# Altium project Servo-Driver-v2.0.PrjPcb (part 20 of 20)
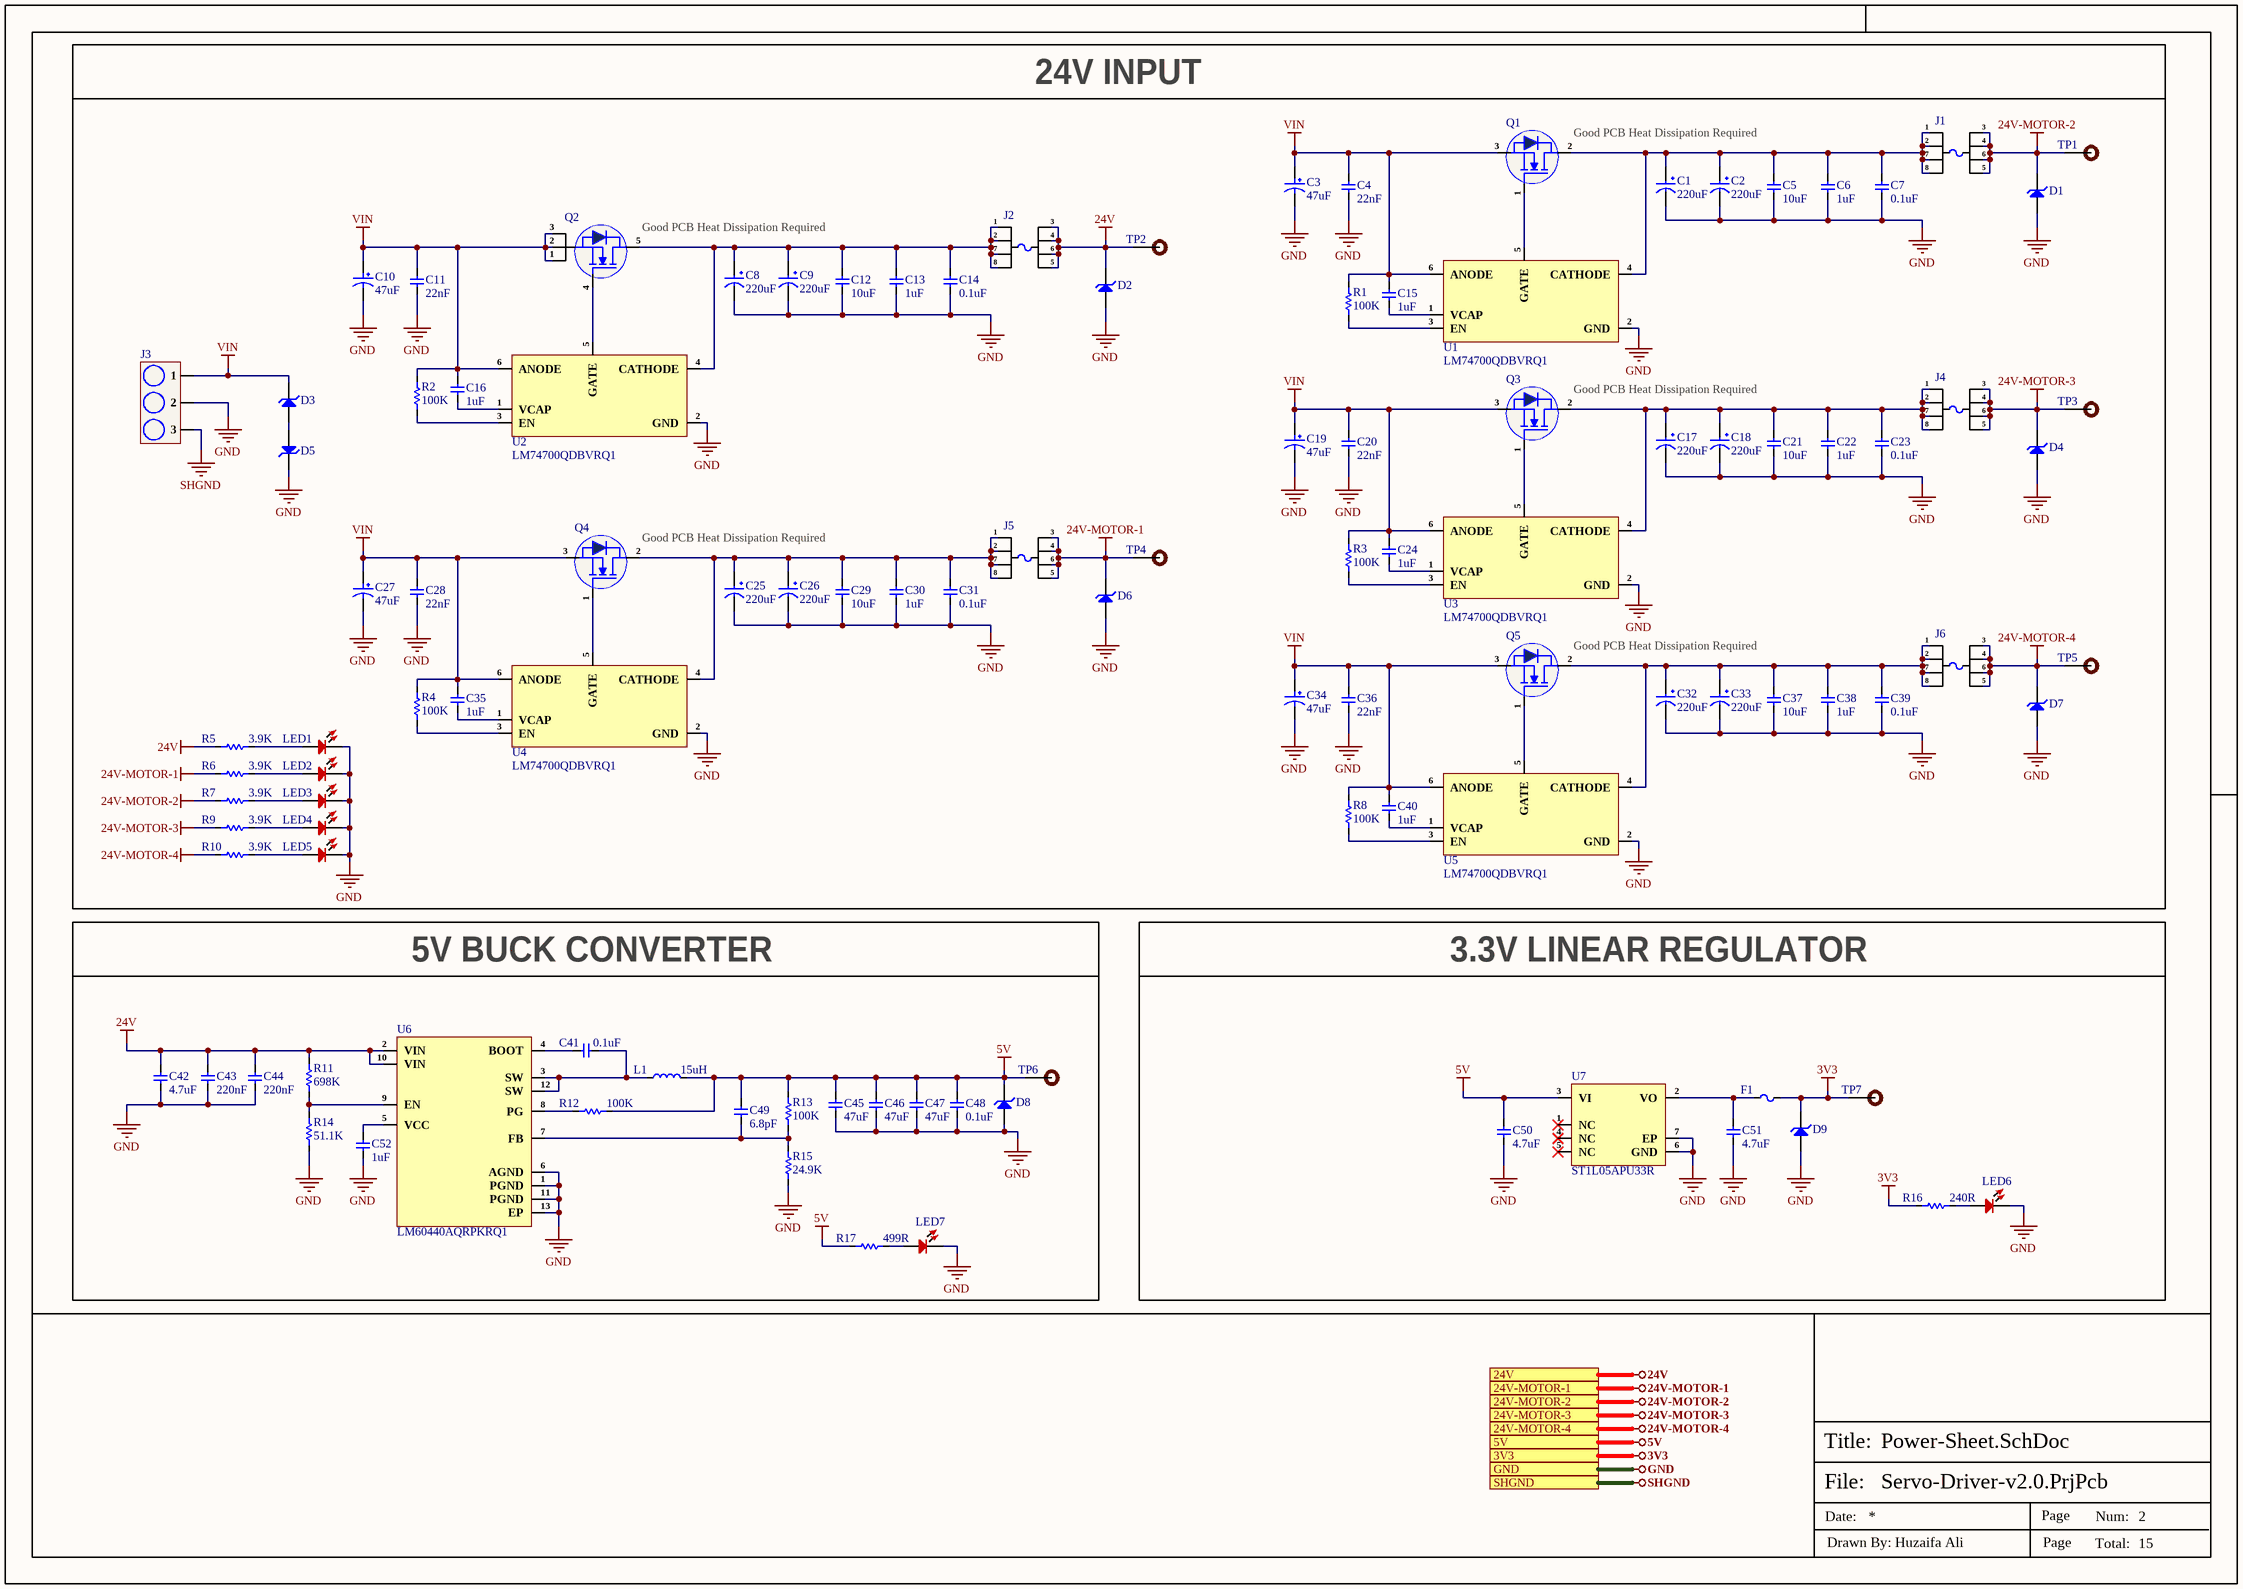
[diagram p114: Power-Sheet.SchDoc]

## Nets that join several sheets
3V3: Controller-Driver-Sheet-4 (Q33.1 R448.2 R449.2 R485.2), MOSFET-Motor-Sheet-4 (C195.2 C197.2 Q41.4 U21.8), Controller-Comms-Sheet-4 (7 pins), Controller-Driver-Sheet-3 (Q24.1 R309.2 R310.2 R346.2), MOSFET-Motor-Sheet-3 (C157.2 C159.2 Q32.4 U17.8), Controller-Comms-Sheet-3 (7 pins), Controller-Driver-Sheet-2 (Q15.1 R170.2 R171.2 R207.2), MOSFET-Motor-Sheet-2 (C119.2 C121.2 Q23.4 U13.8), Controller-Comms-Sheet-2 (7 pins), Controller-Driver-Sheet-1 (Q6.1 R31.2 R32.2 R68.2), MOSFET-Motor-Sheet-1 (C81.2 C83.2 Q14.4 U9.8), Controller-Comms-Sheet-1 (7 pins), Power-Sheet (D9.2 F1.2 R16.1 TP7.1)
5V: Controller-Driver-Sheet-4 (C185.2 LED11.2 R486.2), MOSFET-Motor-Sheet-4 (R559.1 R562.1), Controller-Driver-Sheet-3 (C147.2 LED10.2 R347.2), MOSFET-Motor-Sheet-3 (R420.1 R423.1), Controller-Driver-Sheet-2 (C109.2 LED9.2 R208.2), MOSFET-Motor-Sheet-2 (R281.1 R284.1), Controller-Driver-Sheet-1 (C71.2 LED8.2 R69.2), MOSFET-Motor-Sheet-1 (R142.1 R145.1), Power-Sheet (13 pins)
24V-MOTOR-1: Controller-Driver-Sheet-1 (R25.2 R98.2), MOSFET-Motor-Sheet-1 (11 pins), Power-Sheet (7 pins)
24V-MOTOR-2: Controller-Driver-Sheet-2 (R164.2 R237.2), MOSFET-Motor-Sheet-2 (11 pins), Power-Sheet (7 pins)
24V-MOTOR-3: Controller-Driver-Sheet-3 (R303.2 R376.2), MOSFET-Motor-Sheet-3 (11 pins), Power-Sheet (7 pins)
24V-MOTOR-4: Controller-Driver-Sheet-4 (R442.2 R515.2), MOSFET-Motor-Sheet-4 (11 pins), Power-Sheet (7 pins)
GND: Comms-In (D10.3 D11.3 R18.1 R19.1), Controller-Driver-Sheet-4 (48 pins), MOSFET-Motor-Sheet-4 (29 pins), Controller-Comms-Sheet-4 (8 pins), Controller-Driver-Sheet-3 (48 pins), MOSFET-Motor-Sheet-3 (29 pins), Controller-Comms-Sheet-3 (8 pins), Controller-Driver-Sheet-2 (48 pins), MOSFET-Motor-Sheet-2 (29 pins), Controller-Comms-Sheet-2 (8 pins), Controller-Driver-Sheet-1 (48 pins), MOSFET-Motor-Sheet-1 (29 pins), Controller-Comms-Sheet-1 (8 pins), Power-Sheet (74 pins)
MCU1_VCC: Controller-Driver-Sheet-1 (7 pins), MOSFET-Motor-Sheet-1 (C82.2 Q14.1)
MCU1_VDD: Controller-Driver-Sheet-1 (10 pins), MOSFET-Motor-Sheet-1 (6 pins)
MCU2_VCC: Controller-Driver-Sheet-2 (7 pins), MOSFET-Motor-Sheet-2 (C120.2 Q23.1)
MCU2_VDD: Controller-Driver-Sheet-2 (10 pins), MOSFET-Motor-Sheet-2 (6 pins)
MCU3_VCC: Controller-Driver-Sheet-3 (7 pins), MOSFET-Motor-Sheet-3 (C158.2 Q32.1)
MCU3_VDD: Controller-Driver-Sheet-3 (10 pins), MOSFET-Motor-Sheet-3 (6 pins)
MCU4_VCC: Controller-Driver-Sheet-4 (7 pins), MOSFET-Motor-Sheet-4 (C196.2 Q41.1)
MCU4_VDD: Controller-Driver-Sheet-4 (10 pins), MOSFET-Motor-Sheet-4 (6 pins)
SHGND: MOSFET-Motor-Sheet-4 (J41.4 J44.1), MOSFET-Motor-Sheet-3 (J31.4 J34.1), MOSFET-Motor-Sheet-2 (J21.4 J24.1), MOSFET-Motor-Sheet-1 (J11.4 J14.1), Power-Sheet (J3.3)
CAN_N: Comms-In (D10.2 J7.5), Controller-Comms-Sheet-4 (J46.2 R568.2), Controller-Comms-Sheet-3 (J36.2 R429.2), Controller-Comms-Sheet-2 (J26.2 R290.2), Controller-Comms-Sheet-1 (J16.2 R151.2)
CAN_P: Comms-In (D10.1 J7.4), Controller-Comms-Sheet-4 (R566.2 R569.2), Controller-Comms-Sheet-3 (R427.2 R430.2), Controller-Comms-Sheet-2 (R288.2 R291.2), Controller-Comms-Sheet-1 (R149.2 R152.2)
MCU1_485_DIN: Controller-Driver-Sheet-1 (R61.2), Controller-Comms-Sheet-1 (U11.4)
MCU1_485_ROUT: Controller-Driver-Sheet-1 (R62.2 R72.2), Controller-Comms-Sheet-1 (U11.1)
MCU1_BOOT1: Controller-Driver-Sheet-1 (R66.1 U8.41), MOSFET-Motor-Sheet-1 (C75.2)
MCU1_BOOT2: Controller-Driver-Sheet-1 (R70.1 U8.38), MOSFET-Motor-Sheet-1 (C76.2)
MCU1_BOOT3: Controller-Driver-Sheet-1 (R73.1 U8.35), MOSFET-Motor-Sheet-1 (C77.2)
MCU1_CAN_RX: Controller-Driver-Sheet-1 (R39.2), Controller-Comms-Sheet-1 (R150.1)
MCU1_CAN_SHDN: Controller-Driver-Sheet-1 (R64.2), Controller-Comms-Sheet-1 (R153.1)
MCU1_CAN_STB: Controller-Driver-Sheet-1 (R65.2), Controller-Comms-Sheet-1 (R147.1)
MCU1_CAN_TX: Controller-Driver-Sheet-1 (R40.2), Controller-Comms-Sheet-1 (R148.1)
MCU1_DR_RCV_EN: Controller-Driver-Sheet-1 (R59.2), Controller-Comms-Sheet-1 (R158.1 U11.2 U11.3)
MCU1_GHS1: Controller-Driver-Sheet-1 (U8.43), MOSFET-Motor-Sheet-1 (D25.1 R113.1)
MCU1_GHS2: Controller-Driver-Sheet-1 (U8.40), MOSFET-Motor-Sheet-1 (D26.1 R114.1)
MCU1_GHS3: Controller-Driver-Sheet-1 (U8.37), MOSFET-Motor-Sheet-1 (D27.1 R115.1)
MCU1_GLS1: Controller-Driver-Sheet-1 (U8.29), MOSFET-Motor-Sheet-1 (D28.1 R122.1)
MCU1_GLS2: Controller-Driver-Sheet-1 (U8.30), MOSFET-Motor-Sheet-1 (D29.1 R123.1)
MCU1_GLS3: Controller-Driver-Sheet-1 (U8.31), MOSFET-Motor-Sheet-1 (D30.1 R124.1)
MCU1_HALL1: Controller-Driver-Sheet-1 (R56.2), MOSFET-Motor-Sheet-1 (C86.2 D35.1 R141.1)
MCU1_HALL2: Controller-Driver-Sheet-1 (R58.2), MOSFET-Motor-Sheet-1 (C85.2 D34.1 R143.1)
MCU1_HALL3: Controller-Driver-Sheet-1 (R60.2 R72.1), MOSFET-Motor-Sheet-1 (C84.2 D33.1 R144.1)
MCU1_OUT1: Controller-Driver-Sheet-1 (U8.42), MOSFET-Motor-Sheet-1 (C75.1 R116.1)
MCU1_OUT2: Controller-Driver-Sheet-1 (U8.39), MOSFET-Motor-Sheet-1 (C76.1 R117.1)
MCU1_OUT3: Controller-Driver-Sheet-1 (U8.36), MOSFET-Motor-Sheet-1 (C77.1 R118.1)
MCU1_PA8: Controller-Driver-Sheet-1 (R36.2), MOSFET-Motor-Sheet-1 (Q14.3)
MCU1_PA15: Controller-Driver-Sheet-1 (R43.2), MOSFET-Motor-Sheet-1 (R134.1 U9.2 U9.3)
MCU1_RS485_N: Comms-In (D11.2 J7.2), Controller-Comms-Sheet-4 (R572.2 R574.2 R579.1), Controller-Comms-Sheet-3 (R433.2 R435.2 R577.1), Controller-Comms-Sheet-2 (R294.2 R296.2 R509.1), Controller-Comms-Sheet-1 (R155.2 R157.2 R231.1)
MCU1_RS485_P: Comms-In (D11.1 J7.1), Controller-Comms-Sheet-4 (J47.2 R573.2 R578.1), Controller-Comms-Sheet-3 (J37.2 R434.2 R576.1), Controller-Comms-Sheet-2 (J27.2 R295.2 R370.1), Controller-Comms-Sheet-1 (J17.2 R92.1 R156.2)
MCU1_UART_RX: Controller-Driver-Sheet-1 (R38.2), MOSFET-Motor-Sheet-1 (U9.1)
MCU1_UART_TX: Controller-Driver-Sheet-1 (R37.2), MOSFET-Motor-Sheet-1 (U9.4)
MCU2_485_DIN: Controller-Driver-Sheet-2 (R200.2), Controller-Comms-Sheet-2 (U15.4)
MCU2_485_ROUT: Controller-Driver-Sheet-2 (R201.2 R211.2), Controller-Comms-Sheet-2 (U15.1)
MCU2_BOOT1: Controller-Driver-Sheet-2 (R205.1 U12.41), MOSFET-Motor-Sheet-2 (C113.2)
MCU2_BOOT2: Controller-Driver-Sheet-2 (R209.1 U12.38), MOSFET-Motor-Sheet-2 (C114.2)
MCU2_BOOT3: Controller-Driver-Sheet-2 (R212.1 U12.35), MOSFET-Motor-Sheet-2 (C115.2)
MCU2_CAN_RX: Controller-Driver-Sheet-2 (R178.2), Controller-Comms-Sheet-2 (R289.1)
MCU2_CAN_SHDN: Controller-Driver-Sheet-2 (R203.2), Controller-Comms-Sheet-2 (R292.1)
MCU2_CAN_STB: Controller-Driver-Sheet-2 (R204.2), Controller-Comms-Sheet-2 (R286.1)
MCU2_CAN_TX: Controller-Driver-Sheet-2 (R179.2), Controller-Comms-Sheet-2 (R287.1)
MCU2_DR_RCV_EN: Controller-Driver-Sheet-2 (R198.2), Controller-Comms-Sheet-2 (R297.1 U15.2 U15.3)
MCU2_GHS1: Controller-Driver-Sheet-2 (U12.43), MOSFET-Motor-Sheet-2 (D49.1 R252.1)
MCU2_GHS2: Controller-Driver-Sheet-2 (U12.40), MOSFET-Motor-Sheet-2 (D50.1 R253.1)
MCU2_GHS3: Controller-Driver-Sheet-2 (U12.37), MOSFET-Motor-Sheet-2 (D51.1 R254.1)
MCU2_GLS1: Controller-Driver-Sheet-2 (U12.29), MOSFET-Motor-Sheet-2 (D52.1 R261.1)
MCU2_GLS2: Controller-Driver-Sheet-2 (U12.30), MOSFET-Motor-Sheet-2 (D53.1 R262.1)
MCU2_GLS3: Controller-Driver-Sheet-2 (U12.31), MOSFET-Motor-Sheet-2 (D54.1 R263.1)
MCU2_HALL1: Controller-Driver-Sheet-2 (R195.2), MOSFET-Motor-Sheet-2 (C124.2 D59.1 R280.1)
MCU2_HALL2: Controller-Driver-Sheet-2 (R197.2), MOSFET-Motor-Sheet-2 (C123.2 D58.1 R282.1)
MCU2_HALL3: Controller-Driver-Sheet-2 (R199.2 R211.1), MOSFET-Motor-Sheet-2 (C122.2 D57.1 R283.1)
MCU2_OUT1: Controller-Driver-Sheet-2 (U12.42), MOSFET-Motor-Sheet-2 (C113.1 R255.1)
MCU2_OUT2: Controller-Driver-Sheet-2 (U12.39), MOSFET-Motor-Sheet-2 (C114.1 R256.1)
MCU2_OUT3: Controller-Driver-Sheet-2 (U12.36), MOSFET-Motor-Sheet-2 (C115.1 R257.1)
MCU2_PA8: Controller-Driver-Sheet-2 (R175.2), MOSFET-Motor-Sheet-2 (Q23.3)
MCU2_PA15: Controller-Driver-Sheet-2 (R182.2), MOSFET-Motor-Sheet-2 (R273.1 U13.2 U13.3)
MCU2_UART_RX: Controller-Driver-Sheet-2 (R177.2), MOSFET-Motor-Sheet-2 (U13.1)
MCU2_UART_TX: Controller-Driver-Sheet-2 (R176.2), MOSFET-Motor-Sheet-2 (U13.4)
MCU3_485_DIN: Controller-Driver-Sheet-3 (R339.2), Controller-Comms-Sheet-3 (U19.4)
MCU3_485_ROUT: Controller-Driver-Sheet-3 (R340.2 R350.2), Controller-Comms-Sheet-3 (U19.1)
MCU3_BOOT1: Controller-Driver-Sheet-3 (R344.1 U16.41), MOSFET-Motor-Sheet-3 (C151.2)
MCU3_BOOT2: Controller-Driver-Sheet-3 (R348.1 U16.38), MOSFET-Motor-Sheet-3 (C152.2)
MCU3_BOOT3: Controller-Driver-Sheet-3 (R351.1 U16.35), MOSFET-Motor-Sheet-3 (C153.2)
MCU3_CAN_RX: Controller-Driver-Sheet-3 (R317.2), Controller-Comms-Sheet-3 (R428.1)
MCU3_CAN_SHDN: Controller-Driver-Sheet-3 (R342.2), Controller-Comms-Sheet-3 (R431.1)
MCU3_CAN_STB: Controller-Driver-Sheet-3 (R343.2), Controller-Comms-Sheet-3 (R425.1)
MCU3_CAN_TX: Controller-Driver-Sheet-3 (R318.2), Controller-Comms-Sheet-3 (R426.1)
MCU3_DR_RCV_EN: Controller-Driver-Sheet-3 (R337.2), Controller-Comms-Sheet-3 (R436.1 U19.2 U19.3)
MCU3_GHS1: Controller-Driver-Sheet-3 (U16.43), MOSFET-Motor-Sheet-3 (D73.1 R391.1)
MCU3_GHS2: Controller-Driver-Sheet-3 (U16.40), MOSFET-Motor-Sheet-3 (D74.1 R392.1)
MCU3_GHS3: Controller-Driver-Sheet-3 (U16.37), MOSFET-Motor-Sheet-3 (D75.1 R393.1)
MCU3_GLS1: Controller-Driver-Sheet-3 (U16.29), MOSFET-Motor-Sheet-3 (D76.1 R400.1)
MCU3_GLS2: Controller-Driver-Sheet-3 (U16.30), MOSFET-Motor-Sheet-3 (D77.1 R401.1)
MCU3_GLS3: Controller-Driver-Sheet-3 (U16.31), MOSFET-Motor-Sheet-3 (D78.1 R402.1)
MCU3_HALL1: Controller-Driver-Sheet-3 (R334.2), MOSFET-Motor-Sheet-3 (C162.2 D83.1 R419.1)
MCU3_HALL2: Controller-Driver-Sheet-3 (R336.2), MOSFET-Motor-Sheet-3 (C161.2 D82.1 R421.1)
MCU3_HALL3: Controller-Driver-Sheet-3 (R338.2 R350.1), MOSFET-Motor-Sheet-3 (C160.2 D81.1 R422.1)
MCU3_OUT1: Controller-Driver-Sheet-3 (U16.42), MOSFET-Motor-Sheet-3 (C151.1 R394.1)
MCU3_OUT2: Controller-Driver-Sheet-3 (U16.39), MOSFET-Motor-Sheet-3 (C152.1 R395.1)
MCU3_OUT3: Controller-Driver-Sheet-3 (U16.36), MOSFET-Motor-Sheet-3 (C153.1 R396.1)
MCU3_PA8: Controller-Driver-Sheet-3 (R314.2), MOSFET-Motor-Sheet-3 (Q32.3)
MCU3_PA15: Controller-Driver-Sheet-3 (R321.2), MOSFET-Motor-Sheet-3 (R412.1 U17.2 U17.3)
MCU3_UART_RX: Controller-Driver-Sheet-3 (R316.2), MOSFET-Motor-Sheet-3 (U17.1)
MCU3_UART_TX: Controller-Driver-Sheet-3 (R315.2), MOSFET-Motor-Sheet-3 (U17.4)
MCU4_485_DIN: Controller-Driver-Sheet-4 (R478.2), Controller-Comms-Sheet-4 (U23.4)
MCU4_485_ROUT: Controller-Driver-Sheet-4 (R479.2 R489.2), Controller-Comms-Sheet-4 (U23.1)
MCU4_BOOT1: Controller-Driver-Sheet-4 (R483.1 U20.41), MOSFET-Motor-Sheet-4 (C189.2)
MCU4_BOOT2: Controller-Driver-Sheet-4 (R487.1 U20.38), MOSFET-Motor-Sheet-4 (C190.2)
MCU4_BOOT3: Controller-Driver-Sheet-4 (R490.1 U20.35), MOSFET-Motor-Sheet-4 (C191.2)
MCU4_CAN_RX: Controller-Driver-Sheet-4 (R456.2), Controller-Comms-Sheet-4 (R567.1)
MCU4_CAN_SHDN: Controller-Driver-Sheet-4 (R481.2), Controller-Comms-Sheet-4 (R570.1)
MCU4_CAN_STB: Controller-Driver-Sheet-4 (R482.2), Controller-Comms-Sheet-4 (R564.1)
MCU4_CAN_TX: Controller-Driver-Sheet-4 (R457.2), Controller-Comms-Sheet-4 (R565.1)
MCU4_DR_RCV_EN: Controller-Driver-Sheet-4 (R476.2), Controller-Comms-Sheet-4 (R575.1 U23.2 U23.3)
MCU4_GHS1: Controller-Driver-Sheet-4 (U20.43), MOSFET-Motor-Sheet-4 (D97.1 R530.1)
MCU4_GHS2: Controller-Driver-Sheet-4 (U20.40), MOSFET-Motor-Sheet-4 (D98.1 R531.1)
MCU4_GHS3: Controller-Driver-Sheet-4 (U20.37), MOSFET-Motor-Sheet-4 (D99.1 R532.1)
MCU4_GLS1: Controller-Driver-Sheet-4 (U20.29), MOSFET-Motor-Sheet-4 (D100.1 R539.1)
MCU4_GLS2: Controller-Driver-Sheet-4 (U20.30), MOSFET-Motor-Sheet-4 (D101.1 R540.1)
MCU4_GLS3: Controller-Driver-Sheet-4 (U20.31), MOSFET-Motor-Sheet-4 (D102.1 R541.1)
MCU4_HALL1: Controller-Driver-Sheet-4 (R473.2), MOSFET-Motor-Sheet-4 (C200.2 D107.1 R558.1)
MCU4_HALL2: Controller-Driver-Sheet-4 (R475.2), MOSFET-Motor-Sheet-4 (C199.2 D106.1 R560.1)
MCU4_HALL3: Controller-Driver-Sheet-4 (R477.2 R489.1), MOSFET-Motor-Sheet-4 (C198.2 D105.1 R561.1)
MCU4_OUT1: Controller-Driver-Sheet-4 (U20.42), MOSFET-Motor-Sheet-4 (C189.1 R533.1)
MCU4_OUT2: Controller-Driver-Sheet-4 (U20.39), MOSFET-Motor-Sheet-4 (C190.1 R534.1)
MCU4_OUT3: Controller-Driver-Sheet-4 (U20.36), MOSFET-Motor-Sheet-4 (C191.1 R535.1)
MCU4_PA8: Controller-Driver-Sheet-4 (R453.2), MOSFET-Motor-Sheet-4 (Q41.3)
MCU4_PA15: Controller-Driver-Sheet-4 (R460.2), MOSFET-Motor-Sheet-4 (R551.1 U21.2 U21.3)
MCU4_UART_RX: Controller-Driver-Sheet-4 (R455.2), MOSFET-Motor-Sheet-4 (U21.1)
MCU4_UART_TX: Controller-Driver-Sheet-4 (R454.2), MOSFET-Motor-Sheet-4 (U21.4)
MOT1_U: Controller-Driver-Sheet-1 (R78.1), MOSFET-Motor-Sheet-1 (J11.1 Q7.2 Q10.3 R116.2)
MOT1_V: Controller-Driver-Sheet-1 (R100.1), MOSFET-Motor-Sheet-1 (J11.2 Q8.2 Q11.3 R117.2)
MOT1_VSHUNT1N: Controller-Driver-Sheet-1 (R93.1), MOSFET-Motor-Sheet-1 (NT1.1)
MOT1_VSHUNT1P: Controller-Driver-Sheet-1 (R82.1), MOSFET-Motor-Sheet-1 (Q10.2 R125.2 R126.2)
MOT1_VSHUNT2N: Controller-Driver-Sheet-1 (R94.1), MOSFET-Motor-Sheet-1 (NT2.1)
MOT1_VSHUNT2P: Controller-Driver-Sheet-1 (R83.1), MOSFET-Motor-Sheet-1 (Q11.2 R127.2 R128.2)
MOT1_VSHUNT3N: Controller-Driver-Sheet-1 (R108.1), MOSFET-Motor-Sheet-1 (NT3.1)
MOT1_VSHUNT3P: Controller-Driver-Sheet-1 (R99.1), MOSFET-Motor-Sheet-1 (Q12.2 R129.2 R130.2)
MOT1_W: Controller-Driver-Sheet-1 (R80.1), MOSFET-Motor-Sheet-1 (J11.3 Q9.2 Q12.3 R118.2)
MOT2_U: Controller-Driver-Sheet-2 (R217.1), MOSFET-Motor-Sheet-2 (J21.1 Q16.2 Q19.3 R255.2)
MOT2_V: Controller-Driver-Sheet-2 (R239.1), MOSFET-Motor-Sheet-2 (J21.2 Q17.2 Q20.3 R256.2)
MOT2_VSHUNT1N: Controller-Driver-Sheet-2 (R232.1), MOSFET-Motor-Sheet-2 (NT4.1)
MOT2_VSHUNT1P: Controller-Driver-Sheet-2 (R221.1), MOSFET-Motor-Sheet-2 (Q19.2 R264.2 R265.2)
MOT2_VSHUNT2N: Controller-Driver-Sheet-2 (R233.1), MOSFET-Motor-Sheet-2 (NT5.1)
MOT2_VSHUNT2P: Controller-Driver-Sheet-2 (R222.1), MOSFET-Motor-Sheet-2 (Q20.2 R266.2 R267.2)
MOT2_VSHUNT3N: Controller-Driver-Sheet-2 (R247.1), MOSFET-Motor-Sheet-2 (NT6.1)
MOT2_VSHUNT3P: Controller-Driver-Sheet-2 (R238.1), MOSFET-Motor-Sheet-2 (Q21.2 R268.2 R269.2)
MOT2_W: Controller-Driver-Sheet-2 (R219.1), MOSFET-Motor-Sheet-2 (J21.3 Q18.2 Q21.3 R257.2)
MOT3_U: Controller-Driver-Sheet-3 (R356.1), MOSFET-Motor-Sheet-3 (J31.1 Q25.2 Q28.3 R394.2)
MOT3_V: Controller-Driver-Sheet-3 (R378.1), MOSFET-Motor-Sheet-3 (J31.2 Q26.2 Q29.3 R395.2)
MOT3_VSHUNT1N: Controller-Driver-Sheet-3 (R371.1), MOSFET-Motor-Sheet-3 (NT7.1)
MOT3_VSHUNT1P: Controller-Driver-Sheet-3 (R360.1), MOSFET-Motor-Sheet-3 (Q28.2 R403.2 R404.2)
MOT3_VSHUNT2N: Controller-Driver-Sheet-3 (R372.1), MOSFET-Motor-Sheet-3 (NT8.1)
MOT3_VSHUNT2P: Controller-Driver-Sheet-3 (R361.1), MOSFET-Motor-Sheet-3 (Q29.2 R405.2 R406.2)
MOT3_VSHUNT3N: Controller-Driver-Sheet-3 (R386.1), MOSFET-Motor-Sheet-3 (NT9.1)
MOT3_VSHUNT3P: Controller-Driver-Sheet-3 (R377.1), MOSFET-Motor-Sheet-3 (Q30.2 R407.2 R408.2)
MOT3_W: Controller-Driver-Sheet-3 (R358.1), MOSFET-Motor-Sheet-3 (J31.3 Q27.2 Q30.3 R396.2)
MOT4_U: Controller-Driver-Sheet-4 (R495.1), MOSFET-Motor-Sheet-4 (J41.1 Q34.2 Q37.3 R533.2)
MOT4_V: Controller-Driver-Sheet-4 (R517.1), MOSFET-Motor-Sheet-4 (J41.2 Q35.2 Q38.3 R534.2)
MOT4_VSHUNT1N: Controller-Driver-Sheet-4 (R510.1), MOSFET-Motor-Sheet-4 (NT10.1)
MOT4_VSHUNT1P: Controller-Driver-Sheet-4 (R499.1), MOSFET-Motor-Sheet-4 (Q37.2 R542.2 R543.2)
MOT4_VSHUNT2N: Controller-Driver-Sheet-4 (R511.1), MOSFET-Motor-Sheet-4 (NT11.1)
MOT4_VSHUNT2P: Controller-Driver-Sheet-4 (R500.1), MOSFET-Motor-Sheet-4 (Q38.2 R544.2 R545.2)
MOT4_VSHUNT3N: Controller-Driver-Sheet-4 (R525.1), MOSFET-Motor-Sheet-4 (NT12.1)
MOT4_VSHUNT3P: Controller-Driver-Sheet-4 (R516.1), MOSFET-Motor-Sheet-4 (Q39.2 R546.2 R547.2)
MOT4_W: Controller-Driver-Sheet-4 (R497.1), MOSFET-Motor-Sheet-4 (J41.3 Q36.2 Q39.3 R535.2)